# Altium schematic sheet FR3068E-C_Device_DEV1.4.SchDoc
size A3; SheetNumber: 2; SheetTotal: 3
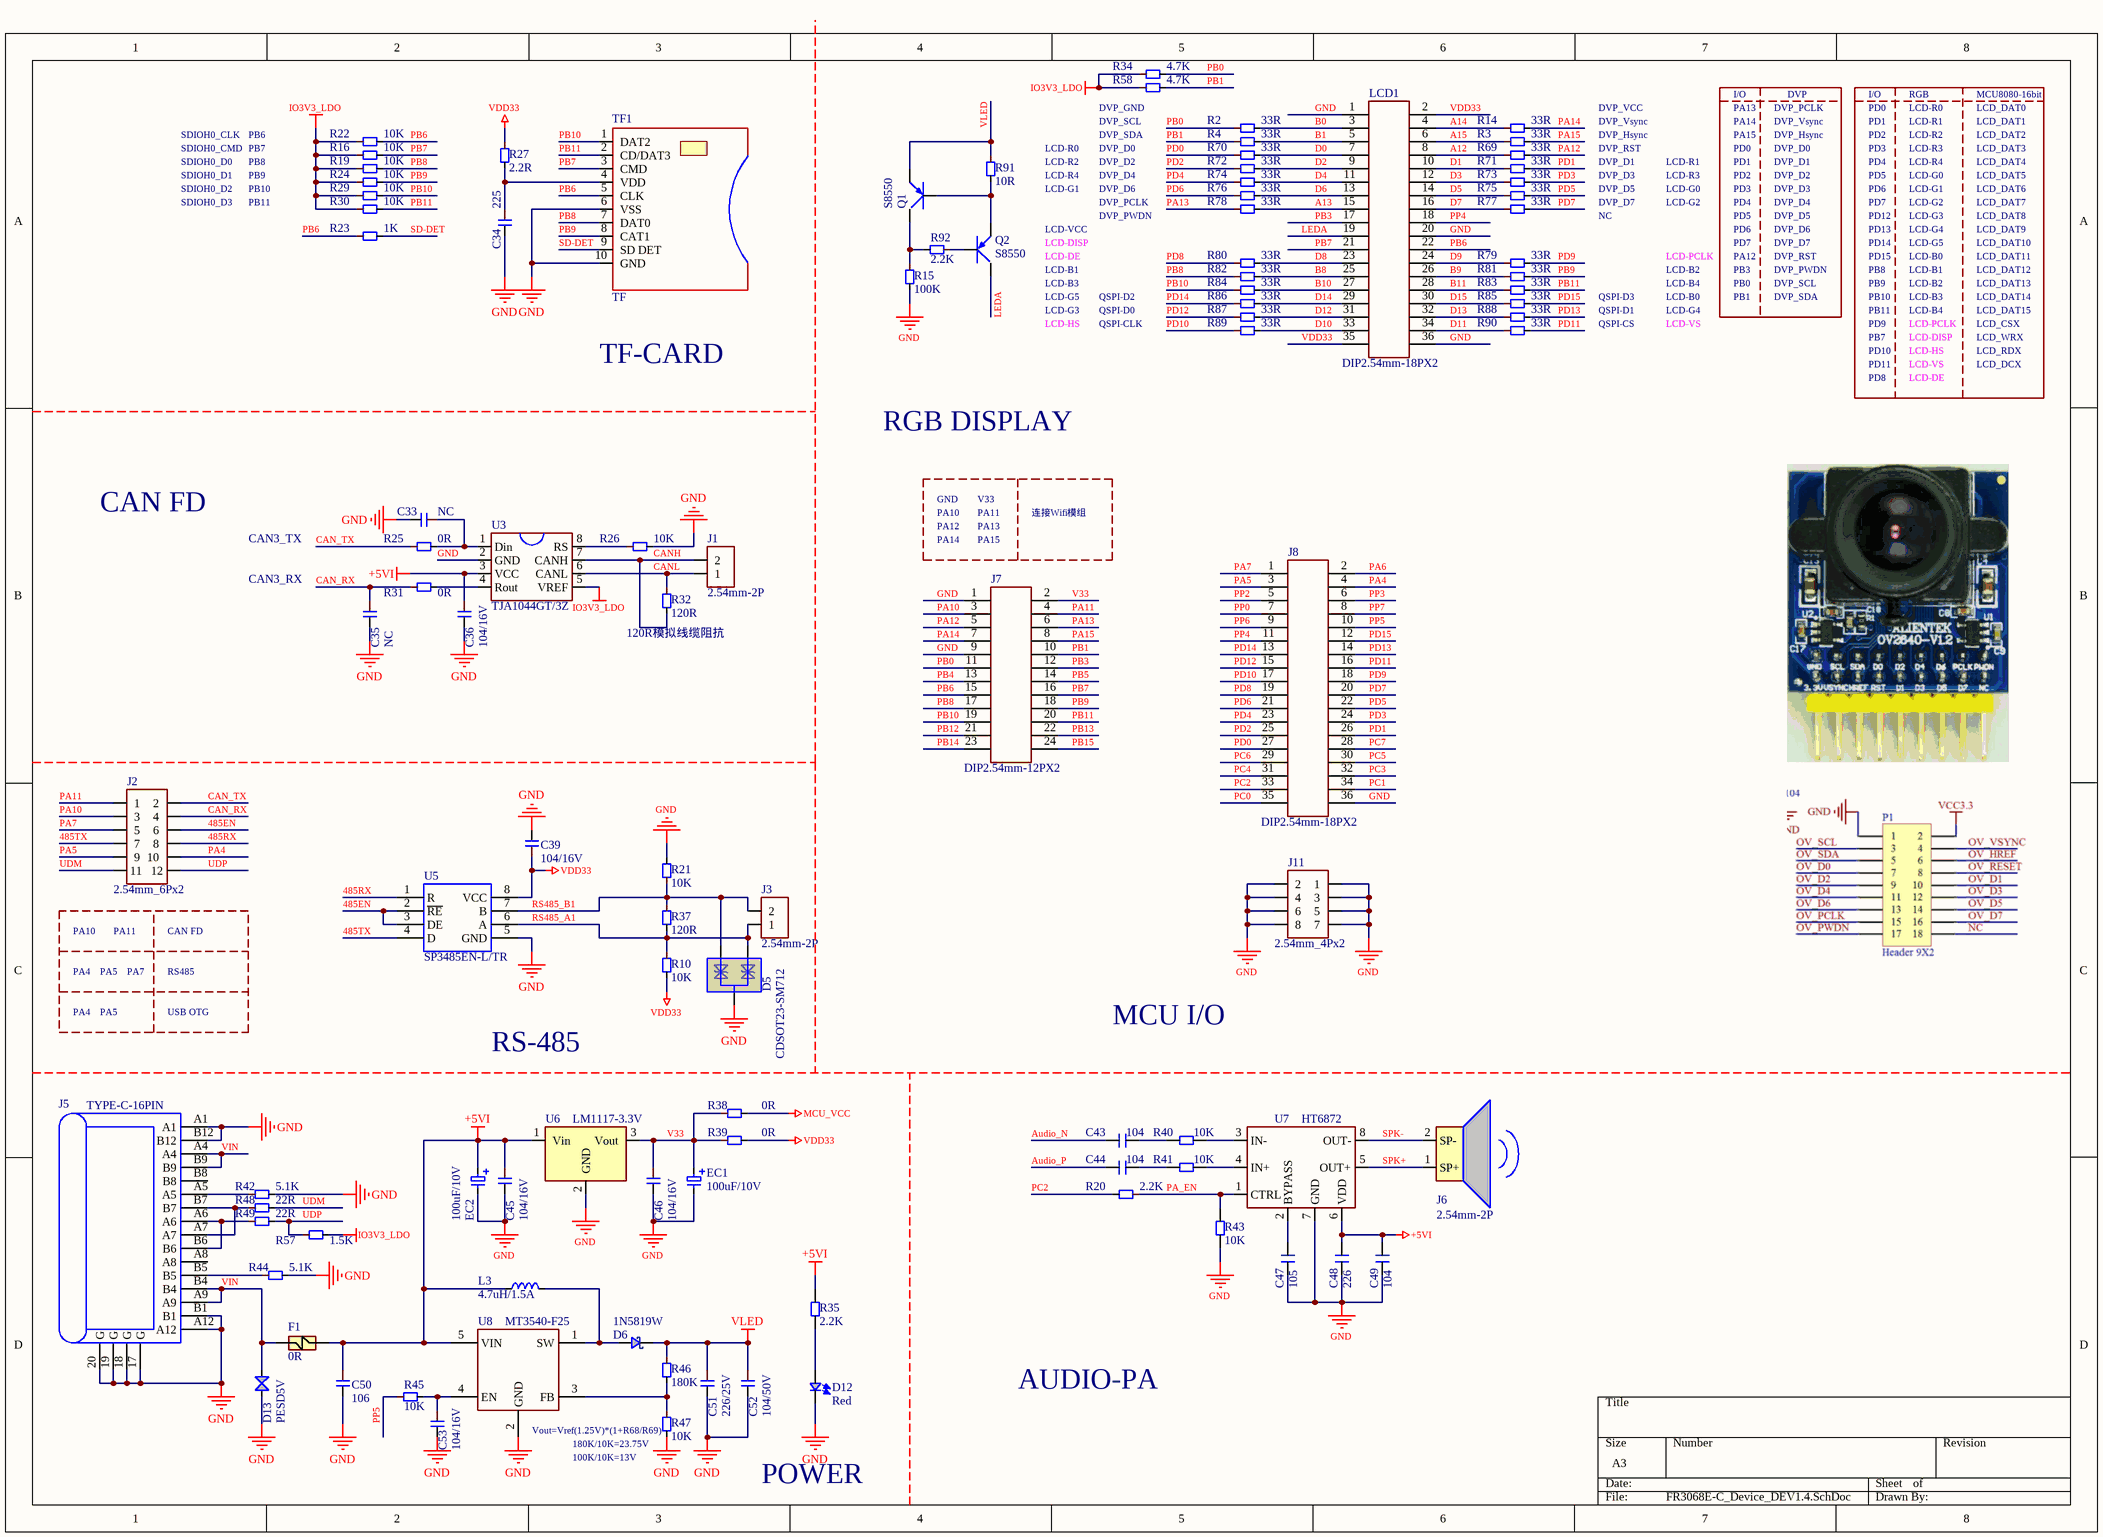
[diagram p0: FR3068E-C_Device_DEV1.4.SchDoc]

## Parts
C33  NC  [C0402]
C34  225  [C0402]
C35  NC  [C0402]
C36  104/16V  [C0402]
C39  104/16V  [C0402]
C43  104  [C0402]
C44  104  [C0402]
C45  104/16V  [C0402]
C46  104/16V  [C0402]
C47  105  [C0402]
C48  226  [C0603]
C49  104  [C0402]
C50  106  [C0603]
C51  226/25V  [C0805]
C52  104/50V  [C0603]
C53  104/16V  [C0402]
D5  CDSOT23-SM712  [SOT23]
D6  1N5819W  [SOD-123]
D12  Red  [D0603]
D13  PESD5V  [R0402]
EC1  100uF/10V  [EC(SMD)6.3_7.7]
EC2  100uF/10V  [EC(SMD)6.3_7.7]
F1  0R  [R1206]
J1  2.54mm-2P  [SIP2P_3.5MM]
J2  2.54mm_6Px2  [2.54mm-6Pinx2]
J3  2.54mm-2P  [SIP2P_3.5MM]
J5  TYPE-C-16PIN  [TYPE_C_L7.35_DIP]
J6  2.54mm-2P  [2.54mm_2PIN]
J7  DIP2.54mm-12PX2  [DIP2.54mm-12PX2]
J8  DIP2.54mm-18PX2  [2.54MM-18PIN *2]
J11  2.54mm_4Px2  [2.54mm-4Pinx2]
L3  4.7uH/1.5A  [CD0403]
LCD1  DIP2.54mm-18PX2  [2.54MM-18PIN *2]
Q1  S8550  [SOT23]
Q2  S8550  [SOT23]
R2  33R  [R0402]
R3  33R  [R0402]
R4  33R  [R0402]
R10  10K  [R0402]
R14  33R  [R0402]
R15  100K  [R0402]
R16  10K  [R0402]
R19  10K  [R0402]
R20  2.2K  [R0402]
R21  10K  [R0402]
R22  10K  [R0402]
R23  1K  [R0402]
R24  10K  [R0402]
R25  0R  [R0402]
R26  10K  [R0402]
R27  2.2R  [R0603]
R29  10K  [R0402]
R30  10K  [R0402]
R31  0R  [R0402]
R32  120R  [R0603]
R34  4.7K  [R0402]
R35  2.2K  [R0402]
R37  120R  [R0603]
R38  0R  [R0603]
R39  0R  [R0603]
R40  10K  [R0402]
R41  10K  [R0402]
R42  5.1K  [R0402]
R43  10K  [R0402]
R44  5.1K  [R0402]
R45  10K  [R0402]
R46  180K  [R0402]
R47  10K  [R0402]
R48  22R  [R0402]
R49  22R  [R0402]
R57  1.5K  [R0402]
R58  4.7K  [R0402]
R69  33R  [R0402]
R70  33R  [R0402]
R71  33R  [R0402]
R72  33R  [R0402]
R73  33R  [R0402]
R74  33R  [R0402]
R75  33R  [R0402]
R76  33R  [R0402]
R77  33R  [R0402]
R78  33R  [R0402]
R79  33R  [R0402]
R80  33R  [R0402]
R81  33R  [R0402]
R82  33R  [R0402]
R83  33R  [R0402]
R84  33R  [R0402]
R85  33R  [R0402]
R86  33R  [R0402]
R87  33R  [R0402]
R88  33R  [R0402]
R89  33R  [R0402]
R90  33R  [R0402]
R91  10R  [R0603]
R92  2.2K  [R0402]
TF1  TF  [TF]
U3  TJA1044GT/3Z  [SOP8]
U5  SP3485EN-L/TR  [SOP8]
U6  LM1117-3.3V  [TO-223]
U7  HT6872  [SOP8]
U8  MT3540-F25  [SOT23-5]

## Nets
+5VI: C36.2 C45.2 C48.2 C49.1 C50.2 EC2.1 F1.1 L3.1 R35.2 U3.3(VCC) U6.1(Vin) U7.6(VDD) U8.5(VIN)
GND: C33.1 C34.1 C35.1 C36.1 C39.1 C45.1 C46.1 C47.2 C48.1 C49.2 C50.1 C51.1 C52.1 C53.1 D5.3 D12.2 D13.2 EC1.2 EC2.2 J5.17(G) J5.18(G) J5.19(G) J5.20(G) J5.A1 J5.A12 J5.B1 J5.B12 J7.1 J7.9 J8.36 J11.1 J11.2 J11.3 J11.4 J11.5 J11.6 J11.7 J11.8 LCD1.1 LCD1.20 LCD1.36 R15.1 R21.1 R26.1 R42.1 R43.1 R44.1 R47.1 TF1.6(VSS) TF1.10(GND) U3.2(GND) U5.5(GND) U6.2(GND) U7.7(GND) U8.2(GND)
IO3V3_LDO: R16.2 R19.2 R22.2 R24.2 R29.2 R30.2 R34.2 R57.1 R58.2 U3.5(VREF)
MCU_VCC: R38.1
VDD33: C39.2 LCD1.2 LCD1.35 R10.1 R27.2 R39.1 U5.8(VCC)
VLED: C51.2 C52.2 D6.2 Q1.2 R46.2 R91.2
485EN: J2.6 U5.2(~{RE}) U5.3(DE)
485RX: J2.8 U5.1(R)
485TX: J2.7 U5.4(D)
A12: LCD1.8 R69.2
A13: LCD1.15 R78.1
A14: LCD1.4 R14.2
A15: LCD1.6 R3.2
Audio_N: C43.1
Audio_P: C44.1
B0: LCD1.3 R2.1
B1: LCD1.5 R4.1
B8: LCD1.25 R82.1
B9: LCD1.26 R81.2
B10: LCD1.27 R84.1
B11: LCD1.28 R83.2
CAN_RX: C35.2 J2.4 R31.2
CAN_TX: J2.2 R25.2
CANH: J1.2 R32.1 U3.7(CANH)
CANL: J1.1 R32.2 U3.6(CANL)
D0: LCD1.7 R70.1
D1: LCD1.10 R71.2
D2: LCD1.9 R72.1
D3: LCD1.12 R73.2
D4: LCD1.11 R74.1
D5: LCD1.14 R75.2
D6: LCD1.13 R76.1
D7: LCD1.16 R77.2
D8: LCD1.23 R80.1
D9: LCD1.24 R79.2
D10: LCD1.33 R89.1
D11: LCD1.34 R90.2
D12: LCD1.31 R87.1
D13: LCD1.32 R88.2
D14: LCD1.29 R86.1
D15: LCD1.30 R85.2
LEDA: LCD1.19 Q2.3
PA4: J2.10 J8.4
PA5: J2.9 J8.3
PA6: J8.2
PA7: J2.5 J8.1
PA10: J2.3 J7.3
PA11: J2.1 J7.4
PA12: J7.5 R69.1
PA13: J7.6 R78.2
PA14: J7.7 R14.1
PA15: J7.8 R3.1
PA_EN: R20.2 R43.2 U7.1(CTRL)
PB0: J7.11 R2.2 R34.1
PB1: J7.10 R4.2 R58.1
PB3: J7.12 LCD1.17
PB4: J7.13
PB5: J7.14
PB6: J7.15 LCD1.22 R22.1 R23.2 TF1.5(CLK)
PB7: J7.16 LCD1.21 R16.1 TF1.3(CMD)
PB8: J7.17 R19.1 R82.2 TF1.7(DAT0)
PB9: J7.18 R24.1 R81.1 TF1.8(CAT1)
PB10: J7.19 R29.1 R84.2 TF1.1(DAT2)
PB11: J7.20 R30.1 R83.1 TF1.2(CD/DAT3)
PB12: J7.21
PB13: J7.22
PB14: J7.23
PB15: J7.24
PC0: J8.35
PC1: J8.34
PC2: J8.33 R20.1
PC3: J8.32
PC4: J8.31
PC5: J8.30
PC6: J8.29
PC7: J8.28
PD0: J8.27 R70.2
PD1: J8.26 R71.1
PD2: J8.25 R72.2
PD3: J8.24 R73.1
PD4: J8.23 R74.2
PD5: J8.22 R75.1
PD6: J8.21 R76.2
PD7: J8.20 R77.1
PD8: J8.19 R80.2
PD9: J8.18 R79.1
PD10: J8.17 R89.2
PD11: J8.16 R90.1
PD12: J8.15 R87.2
PD13: J8.14 R88.1
PD14: J8.13 R86.2
PD15: J8.12 R85.1
PP0: J8.7
PP2: J8.5
PP3: J8.6
PP4: J8.11 LCD1.18
PP5: J8.10 R45.2
PP6: J8.9
PP7: J8.8
RS485_A1: D5.1 J3.1 R10.2 R37.1 U5.6(A)
RS485_B1: D5.2 J3.2 R21.2 R37.2 U5.7(B)
SD-DET: R23.1 TF1.9(SD_DET)
SPK+: J6.1(SP+) U7.5(OUT+)
SPK-: J6.2(SP-) U7.8(OUT-)
UDM: J2.11 R48.1
UDP: J2.12 R49.1 R57.2
V33: C46.2 EC1.1 J7.2 R38.2 R39.2 U6.3(Vout)
VIN: D13.1 F1.2 J5.A4 J5.A9 J5.B4 J5.B9
NetC33_2: C33.2 R25.1 U3.1(Din)
NetC34_2: C34.2 R27.1 TF1.4(VDD)
NetC43_2: C43.2 R40.1
NetC44_2: C44.2 R41.1
NetC47_1: C47.1 U7.2(BYPASS)
NetC53_2: C53.2 R45.1 U8.4(EN)
NetD6_1: D6.1 L3.2 U8.1(SW)
NetD12_1: D12.1 R35.1
NetJ5_A5: J5.A5 R42.2
NetJ5_A6: J5.A6 J5.B6 R49.2
NetJ5_A7: J5.A7 J5.B7 R48.2
NetJ5_B5: J5.B5 R44.2
NetQ1_1: Q1.1 Q2.2 R91.1
NetQ1_3: Q1.3 R15.2 R92.1
NetQ2_1: Q2.1 R92.2
NetR26_2: R26.2 U3.8(RS)
NetR31_1: R31.1 U3.4(Rout)
NetR40_2: R40.2 U7.3(IN-)
NetR41_2: R41.2 U7.4(IN+)
NetR46_1: R46.1 R47.2 U8.3(FB)

Not connected (* = marked no-connect by the designer): J5 A8 B8

## Notes on the sheet
- SDIOH0_CLK
- PB6
- DVP_SCL
- DVP_SDA
- DVP_GND
- DVP_Vsync
- DVP_Hsync
- DVP_VCC
- PA13
- PA14
- PA15
- I/O
- DVP_PCLK
- DVP
- PD0
- PD1
- PD2
- LCD-R0
- LCD-R1
- LCD-R2
- RGB
- LCD_DAT0
- LCD_DAT1
- LCD_DAT2
- MCU8080-16bit
- SDIOH0_D0
- SDIOH0_D1
- SDIOH0_D2
- SDIOH0_D3
- SDIOH0_CMD
- PB7
- PB8
- PB9
- PB10
- PB11
- LCD-R4
- LCD-G1
- DVP_D0
- DVP_D2
- DVP_D4
- DVP_D6
- DVP_D1
- DVP_D3
- DVP_D5
- DVP_D7
- DVP_RST
- LCD-R3
- LCD-G0
- LCD-G2
- PD3
- PD4
- PD5
- PD6
- PD7
- LCD_DAT3
- LCD_DAT4
- LCD_DAT5
- LCD_DAT6
- LCD_DAT7
- LCD-DE
- LCD-DISP
- LCD-B1
- LCD-VCC
- DVP_PWDN
- NC
- LCD-PCLK
- LCD-B2
- PA12
- PB3
- PD12
- PD13
- PD14
- PD15
- LCD-G3
- LCD-G4
- LCD-G5
- LCD-B0
- LCD_DAT8
- LCD_DAT9
- LCD_DAT10
- LCD_DAT11
- LCD_DAT12
- LCD-HS
- LCD-B3
- QSPI-D0
- QSPI-D2
- QSPI-CLK
- QSPI-D1
- QSPI-D3
- QSPI-CS
- LCD-VS
- LCD-B4
- PB0
- PB1
- PD9
- LCD_DAT13
- LCD_DAT14
- LCD_DAT15
- LCD_CSX
- LCD_WRX
- TF-CARD
- PD8
- PD10
- PD11
- LCD_RDX
- LCD_DCX
- RGB DISPLAY
- CAN FD
- CAN3_TX
- PA10
- GND
- PA11
- V33
- 连接Wifi模组
- CAN3_RX
- (near R32) 120R模拟线缆阻抗
- PA4
- PA5
- PA7
- RS485
- USB OTG
- RS-485
- MCU I/O
- AUDIO-PA
- (near R47) Vout=Vref(1.25V)*(1+R68/R69)
- 180K/10K=23.75V
- 100K/10K=13V
- POWER

## Library data of the parts
C33-C36 C39 C43-C53 = C: PartName: 贴片电容
D5 = TVS-CDSOT23-SM712
D6 = 1N5819
D12 = LED
D13 = ESD
EC1 EC2 = ELECTRO: Parameter 1: C280394
F1 = FUSE
J1 J3 = 2.54mm_Single_Row_2Pin
J5 = TYPE-C-16PIN: 沉板
J6 = Speaker
J7 = 2.54mm-12PX2
J8 LCD1 = 2.54mm-18PX2
L3 = L
Q1 Q2 = PNP
R2-R4 R10 R14-R16 R19-R27 R29-R32 R34 R35 R37-R49 R57 R58 R69-R92 = R
U3 = SN65HVD230DR
U5 = SN65HVD11DR
U6 = LM1117
U8 = DC/DC_MT3450